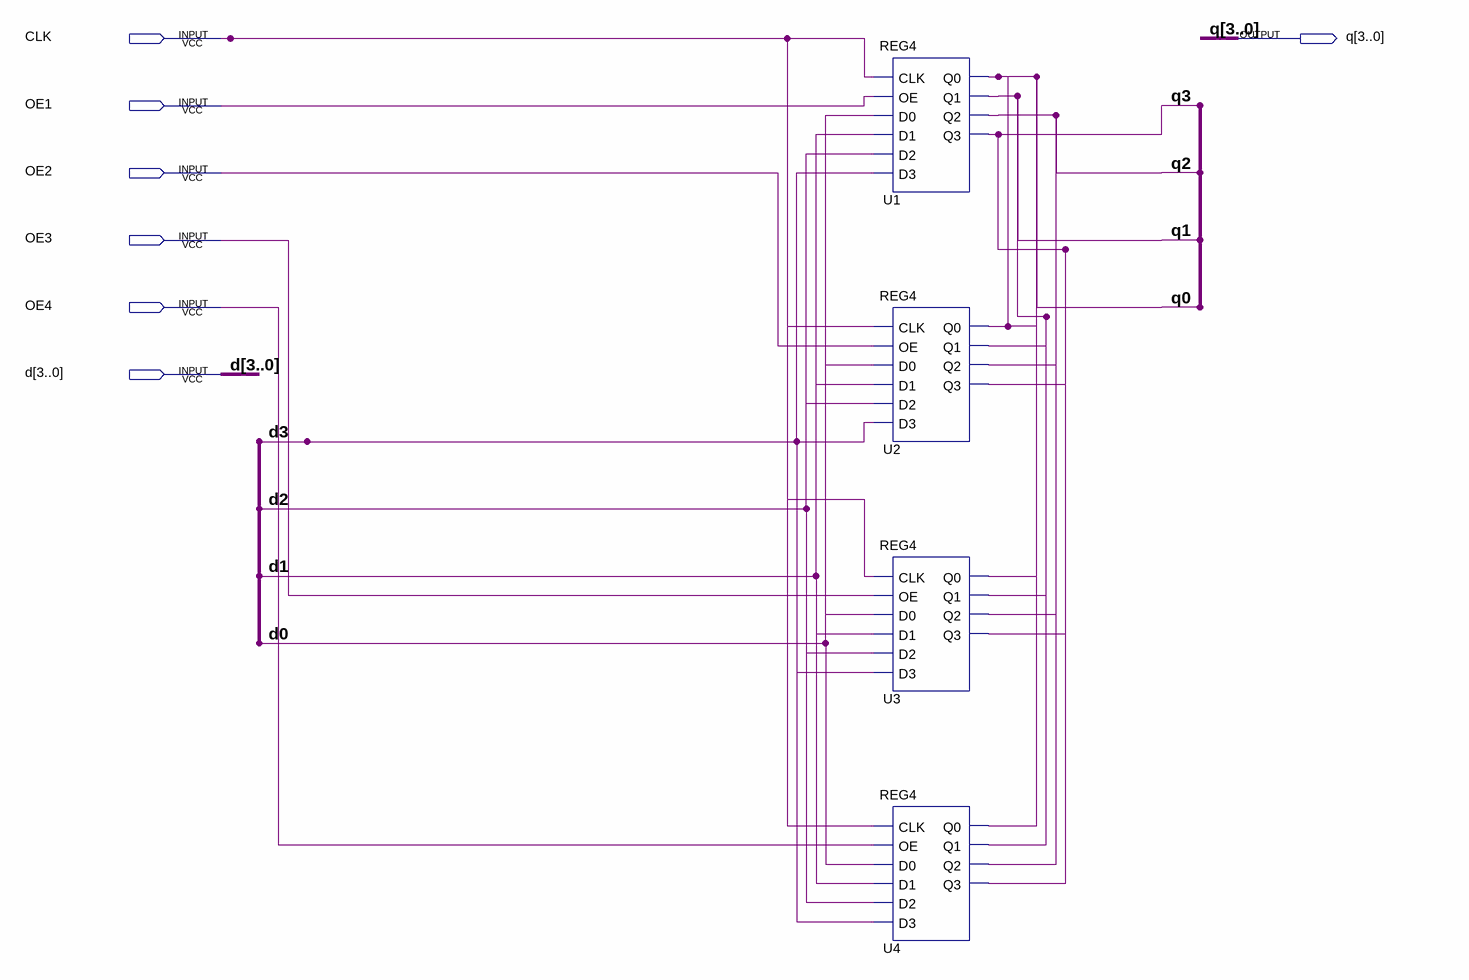
[diagram p0: schematic sheet]
// Quartus schematic BANK4.bdf as structural Verilog: 4 symbols, 7 pins
module BANK4 (
  input  CLK,
  input  OE1,
  input  OE2,
  input  OE3,
  input  OE4,
  input  [3:0] d,
  output [3:0] q
);

  REG4 U1 (.CLK(CLK), .OE(OE1), .D0(d[0]), .D1(d[1]), .D2(d[2]), .D3(d[3]), .Q0(q[0]), .Q1(q[1]), .Q2(q[2]), .Q3(q[3]));
  REG4 U2 (.CLK(CLK), .OE(OE2), .D0(d[0]), .D1(d[1]), .D2(d[2]), .D3(d[3]), .Q0(q[0]), .Q1(q[1]), .Q2(q[2]), .Q3(q[3]));
  REG4 U3 (.CLK(CLK), .OE(OE3), .D0(d[0]), .D1(d[1]), .D2(d[2]), .D3(d[3]), .Q0(q[0]), .Q1(q[1]), .Q2(q[2]), .Q3(q[3]));
  REG4 U4 (.CLK(CLK), .OE(OE4), .D0(d[0]), .D1(d[1]), .D2(d[2]), .D3(d[3]), .Q0(q[0]), .Q1(q[1]), .Q2(q[2]), .Q3(q[3]));
endmodule
